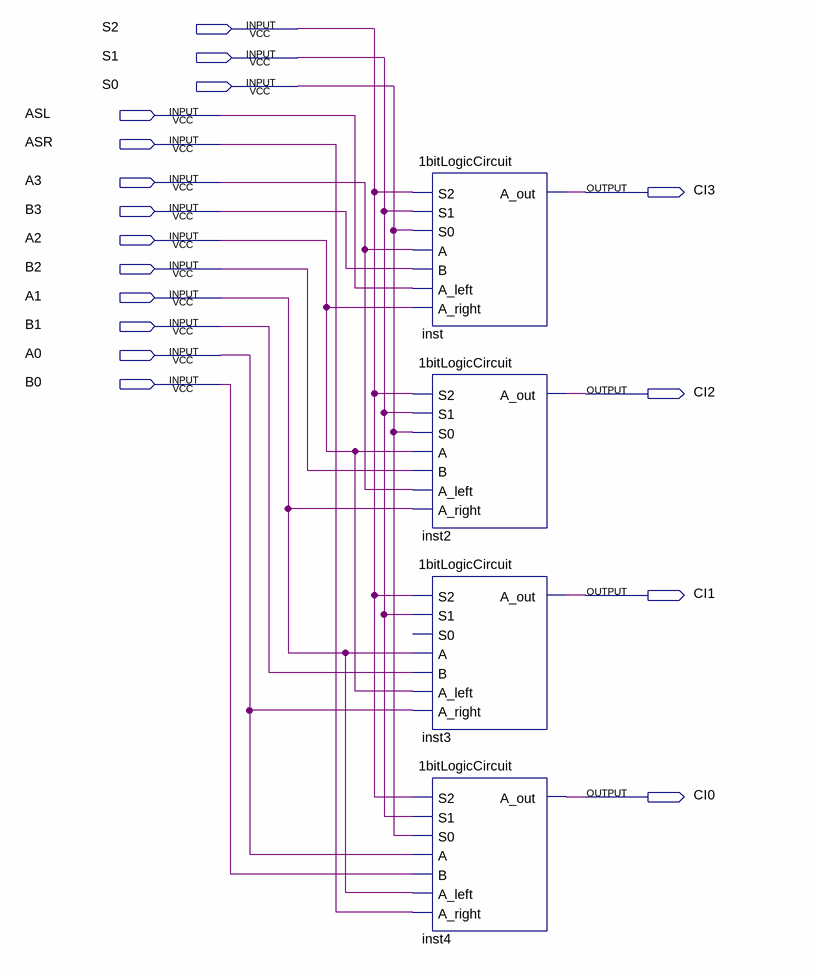
[diagram p0: schematic sheet]
// Quartus schematic 4bitLogicCircuit.bdf as structural Verilog: 4 symbols, 17 pins
module \4bitLogicCircuit  (
  input  S2,
  input  S1,
  input  S0,
  input  ASL,
  input  ASR,
  input  A3,
  input  B3,
  input  A2,
  input  B2,
  input  A1,
  input  B1,
  input  A0,
  input  B0,
  output CI3,
  output CI2,
  output CI1,
  output CI0
);

  \1bitLogicCircuit  inst (.S2(S2), .S1(S1), .S0(S0), .A(A3), .B(B3), .A_left(ASL), .A_right(A2), .A_out(CI3));
  \1bitLogicCircuit  inst2 (.S2(S2), .S1(S1), .S0(S0), .A(A2), .B(B2), .A_left(A3), .A_right(A1), .A_out(CI2));
  \1bitLogicCircuit  inst3 (.S2(S2), .S1(S1), .A(A1), .B(B1), .A_left(A2), .A_right(A0), .A_out(CI1));  // open: S0
  \1bitLogicCircuit  inst4 (.S2(S2), .S1(S1), .S0(S0), .A(A0), .B(B0), .A_left(A1), .A_right(ASR), .A_out(CI0));
endmodule
